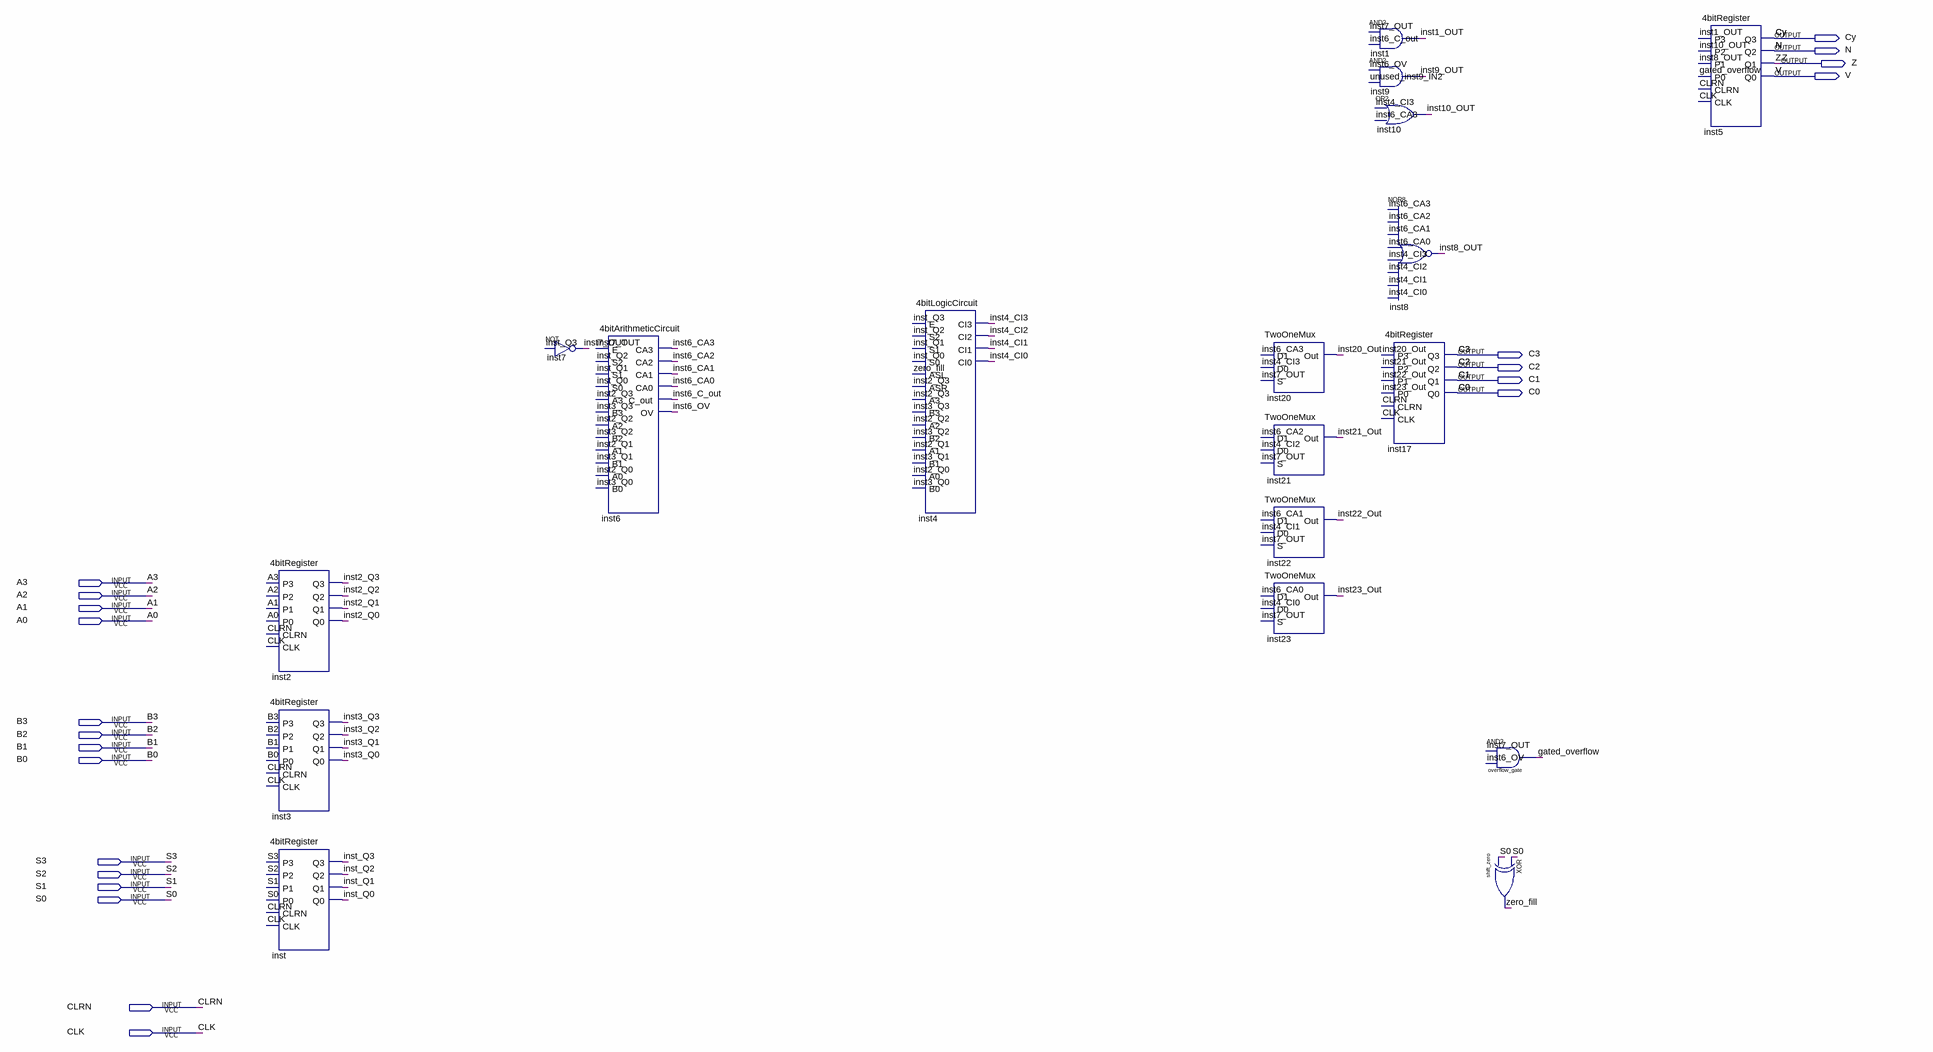
[diagram p0: schematic sheet]
// Quartus schematic Lab3_top.bdf as structural Verilog: 18 symbols, 22 pins
module Lab3_top (
  input  A3,
  input  A2,
  input  A1,
  input  A0,
  input  B3,
  input  B2,
  input  B1,
  input  B0,
  input  S3,
  input  S2,
  input  S1,
  input  S0,
  input  CLRN,
  input  CLK,
  output Cy,
  output N,
  output Z,
  output V,
  output C3,
  output C2,
  output C1,
  output C0
);

  wire gated_overflow, inst1_OUT, inst2_Q0, inst2_Q1, inst2_Q2, inst2_Q3, inst3_Q0, inst3_Q1, inst3_Q2,
       inst3_Q3, inst4_CI0, inst4_CI1, inst4_CI2, inst4_CI3, inst6_C_out, inst6_CA0, inst6_CA1, inst6_CA2,
       inst6_CA3, inst6_OV, inst7_OUT, inst8_OUT, inst9_OUT, inst10_OUT, inst20_Out, inst21_Out, inst22_Out,
       inst23_Out, inst_Q0, inst_Q1, inst_Q2, inst_Q3, unused_inst9_IN2, zero_fill;

  \4bitRegister  inst2 (
    .P3(A3), .P2(A2), .P1(A1), .P0(A0), .CLRN(CLRN), .CLK(CLK), .Q3(inst2_Q3), .Q2(inst2_Q2), .Q1(inst2_Q1),
    .Q0(inst2_Q0));
  \4bitRegister  inst3 (
    .P3(B3), .P2(B2), .P1(B1), .P0(B0), .CLRN(CLRN), .CLK(CLK), .Q3(inst3_Q3), .Q2(inst3_Q2), .Q1(inst3_Q1),
    .Q0(inst3_Q0));
  \4bitRegister  inst (
    .P3(S3), .P2(S2), .P1(S1), .P0(S0), .CLRN(CLRN), .CLK(CLK), .Q3(inst_Q3), .Q2(inst_Q2), .Q1(inst_Q1),
    .Q0(inst_Q0));
  not inst7 (inst7_OUT, inst_Q3);
  \4bitArithmeticCircuit  inst6 (
    .E(inst7_OUT), .S2(inst_Q2), .S1(inst_Q1), .S0(inst_Q0), .A3(inst2_Q3), .B3(inst3_Q3), .A2(inst2_Q2),
    .B2(inst3_Q2), .A1(inst2_Q1), .B1(inst3_Q1), .A0(inst2_Q0), .B0(inst3_Q0), .CA3(inst6_CA3),
    .CA2(inst6_CA2), .CA1(inst6_CA1), .CA0(inst6_CA0), .C_out(inst6_C_out), .OV(inst6_OV));
  \4bitLogicCircuit  inst4 (
    .E(inst_Q3), .S2(inst_Q2), .S1(inst_Q1), .S0(inst_Q0), .ASL(zero_fill), .ASR(inst2_Q3), .A3(inst2_Q3),
    .B3(inst3_Q3), .A2(inst2_Q2), .B2(inst3_Q2), .A1(inst2_Q1), .B1(inst3_Q1), .A0(inst2_Q0), .B0(inst3_Q0),
    .CI3(inst4_CI3), .CI2(inst4_CI2), .CI1(inst4_CI1), .CI0(inst4_CI0));
  TwoOneMux inst20 (.D1(inst6_CA3), .D0(inst4_CI3), .S(inst7_OUT), .Out(inst20_Out));
  TwoOneMux inst21 (.D1(inst6_CA2), .D0(inst4_CI2), .S(inst7_OUT), .Out(inst21_Out));
  TwoOneMux inst22 (.D1(inst6_CA1), .D0(inst4_CI1), .S(inst7_OUT), .Out(inst22_Out));
  TwoOneMux inst23 (.D1(inst6_CA0), .D0(inst4_CI0), .S(inst7_OUT), .Out(inst23_Out));
  and inst1 (inst1_OUT, inst7_OUT, inst6_C_out);
  and inst9 (inst9_OUT, inst6_OV, unused_inst9_IN2);
  or inst10 (inst10_OUT, inst4_CI3, inst6_CA3);
  nor inst8 (inst8_OUT, inst6_CA3, inst6_CA2, inst6_CA1, inst6_CA0, inst4_CI3, inst4_CI2, inst4_CI1, inst4_CI0);
  \4bitRegister  inst17 (
    .P3(inst20_Out), .P2(inst21_Out), .P1(inst22_Out), .P0(inst23_Out), .CLRN(CLRN), .CLK(CLK), .Q3(C3),
    .Q2(C2), .Q1(C1), .Q0(C0));
  and overflow_gate (gated_overflow, inst7_OUT, inst6_OV);
  xor shift_zero (zero_fill, S0, S0);
  \4bitRegister  inst5 (
    .P3(inst1_OUT), .P2(inst10_OUT), .P1(inst8_OUT), .P0(gated_overflow), .CLRN(CLRN), .CLK(CLK), .Q3(Cy),
    .Q2(N), .Q1(Z), .Q0(V));
endmodule
